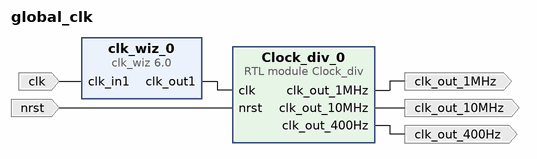
[diagram p0: block diagram of the top level]
# Vivado block design global_clk, xc7z020clg400-1, Vivado 2023.1
create_bd_design global_clk

create_bd_port -dir I clk
create_bd_port -dir I nrst
create_bd_port -dir O clk_out_400Hz
create_bd_port -dir O clk_out_1MHz
create_bd_port -dir O clk_out_10MHz

create_bd_cell -type ip -vlnv xilinx.com:ip:clk_wiz:6.0 clk_wiz_0
set_property -dict [list \
  CONFIG.CLKIN1_JITTER_PS 80.0 \
  CONFIG.CLKOUT1_DRIVES BUFG \
  CONFIG.CLKOUT1_JITTER 237.312 \
  CONFIG.CLKOUT1_PHASE_ERROR 249.865 \
  CONFIG.CLKOUT2_DRIVES BUFG \
  CONFIG.CLKOUT3_DRIVES BUFG \
  CONFIG.CLKOUT4_DRIVES BUFG \
  CONFIG.CLKOUT5_DRIVES BUFG \
  CONFIG.CLKOUT6_DRIVES BUFG \
  CONFIG.CLKOUT7_DRIVES BUFG \
  CONFIG.CLK_IN1_BOARD_INTERFACE sys_clock \
  CONFIG.MMCM_BANDWIDTH OPTIMIZED \
  CONFIG.MMCM_CLKFBOUT_MULT_F 36 \
  CONFIG.MMCM_CLKIN1_PERIOD 8.000 \
  CONFIG.MMCM_CLKIN2_PERIOD 10.0 \
  CONFIG.MMCM_CLKOUT0_DIVIDE_F 9 \
  CONFIG.MMCM_COMPENSATION ZHOLD \
  CONFIG.MMCM_DIVCLK_DIVIDE 5 \
  CONFIG.PLL_CLKIN_PERIOD 8.000 \
  CONFIG.PRIMITIVE PLL \
] [get_bd_cells clk_wiz_0]
create_bd_cell -type module -reference Clock_div Clock_div_0

# ---- connections ----

connect_bd_net [get_bd_pins Clock_div_0/clk_out_10MHz] [get_bd_ports clk_out_10MHz]
connect_bd_net [get_bd_pins Clock_div_0/clk_out_1MHz] [get_bd_ports clk_out_1MHz]
connect_bd_net [get_bd_pins Clock_div_0/clk_out_400Hz] [get_bd_ports clk_out_400Hz]
connect_bd_net [get_bd_ports clk] [get_bd_pins clk_wiz_0/clk_in1]
connect_bd_net [get_bd_pins clk_wiz_0/clk_out1] [get_bd_pins Clock_div_0/clk]
connect_bd_net [get_bd_ports nrst] [get_bd_pins Clock_div_0/nrst]

validate_bd_design
save_bd_design
